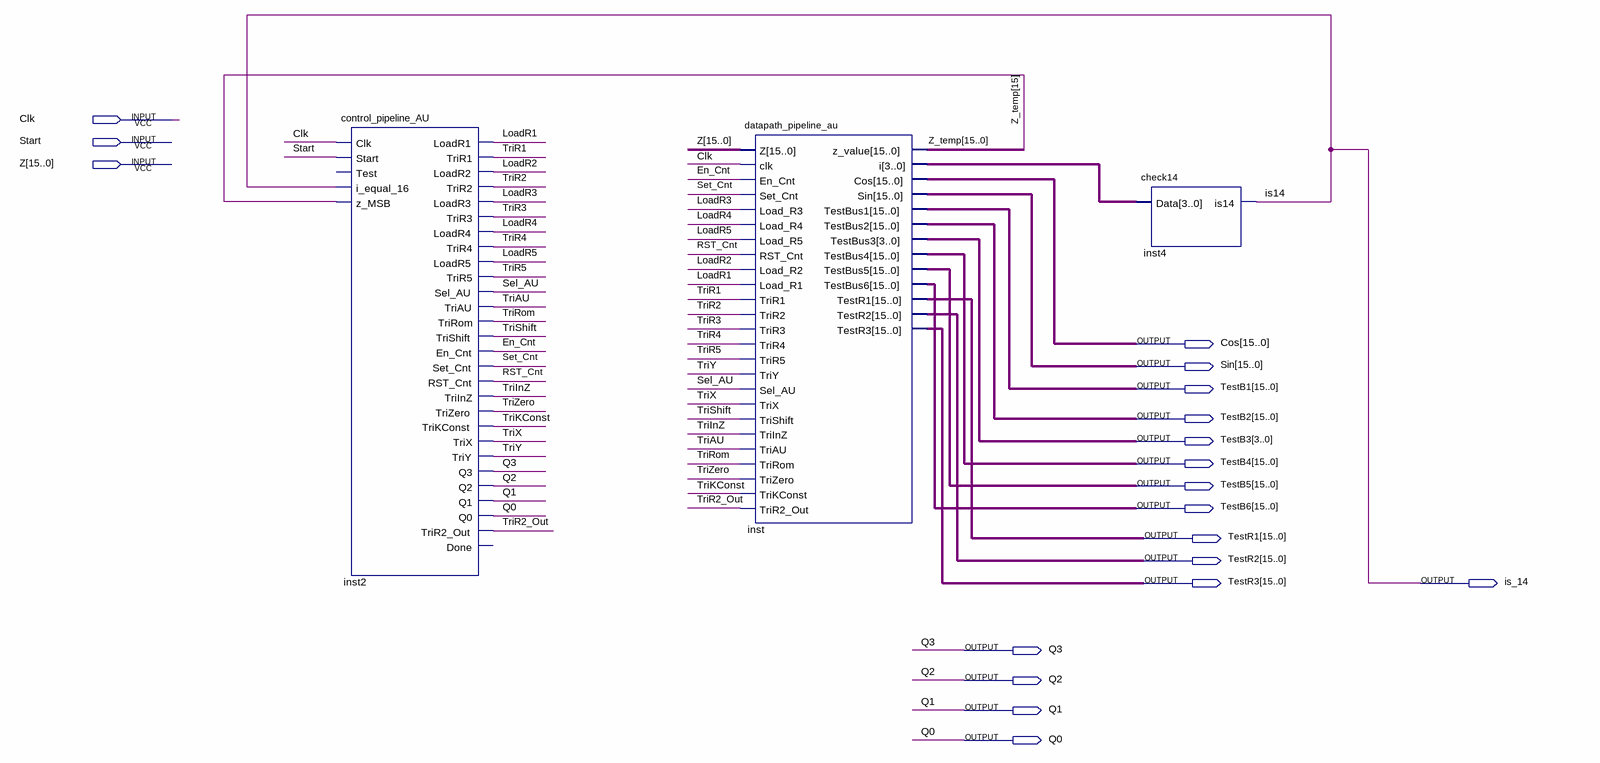
[diagram p0: schematic sheet]
// Quartus schematic ver2_pipeline_au.bdf as structural Verilog: 3 symbols, 19 pins
module ver2_pipeline_au (
  input  Clk,
  input  Start,
  input  [15:0] Z,
  output [15:0] Cos,
  output [15:0] Sin,
  output [15:0] TestB1,
  output [15:0] TestB2,
  output [3:0] TestB3,
  output [15:0] TestB4,
  output [15:0] TestB5,
  output [15:0] TestB6,
  output [15:0] TestR1,
  output [15:0] TestR2,
  output [15:0] TestR3,
  output is_14,
  output Q3,
  output Q2,
  output Q1,
  output Q0
);

  wire En_Cnt, LoadR1, LoadR2, LoadR3, LoadR4, LoadR5, RST_Cnt, Sel_AU, Set_Cnt, TriAU, TriInZ, TriKConst,
       TriR1, TriR2, TriR2_Out, TriR3, TriR4, TriR5, TriRom, TriShift, TriX, TriY, TriZero;
  wire [3:0] inst_i;
  wire [15:0] Z_temp;

  control_pipeline_AU inst2 (
    .Clk(Clk), .Start(Start), .i_equal_16(is_14), .z_MSB(Z_temp[15]), .LoadR1(LoadR1), .TriR1(TriR1),
    .LoadR2(LoadR2), .TriR2(TriR2), .LoadR3(LoadR3), .TriR3(TriR3), .LoadR4(LoadR4), .TriR4(TriR4),
    .LoadR5(LoadR5), .TriR5(TriR5), .Sel_AU(Sel_AU), .TriAU(TriAU), .TriRom(TriRom), .TriShift(TriShift),
    .En_Cnt(En_Cnt), .Set_Cnt(Set_Cnt), .RST_Cnt(RST_Cnt), .TriInZ(TriInZ), .TriZero(TriZero),
    .TriKConst(TriKConst), .TriX(TriX), .TriY(TriY), .Q3(Q3), .Q2(Q2), .Q1(Q1), .Q0(Q0), .TriR2_Out(TriR2_Out));  // open: Test, Done
  datapath_pipeline_au inst (
    .Z(Z), .clk(Clk), .En_Cnt(En_Cnt), .Set_Cnt(Set_Cnt), .Load_R3(LoadR3), .Load_R4(LoadR4),
    .Load_R5(LoadR5), .RST_Cnt(RST_Cnt), .Load_R2(LoadR2), .Load_R1(LoadR1), .TriR1(TriR1), .TriR2(TriR2),
    .TriR3(TriR3), .TriR4(TriR4), .TriR5(TriR5), .TriY(TriY), .Sel_AU(Sel_AU), .TriX(TriX),
    .TriShift(TriShift), .TriInZ(TriInZ), .TriAU(TriAU), .TriRom(TriRom), .TriZero(TriZero),
    .TriKConst(TriKConst), .TriR2_Out(TriR2_Out), .z_value(Z_temp), .i(inst_i), .Cos(Cos), .Sin(Sin),
    .TestBus1(TestB1), .TestBus2(TestB2), .TestBus3(TestB3), .TestBus4(TestB4), .TestBus5(TestB5),
    .TestBus6(TestB6), .TestR1(TestR1), .TestR2(TestR2), .TestR3(TestR3));
  check14 inst4 (.Data(inst_i), .is14(is_14));

  // Other names for the same wires on the sheet: is14 = is_14
endmodule
